# Altium schematic sheet 13_Radar_interfaces_and_QSPI.SchDoc
size 289 x 575 mm
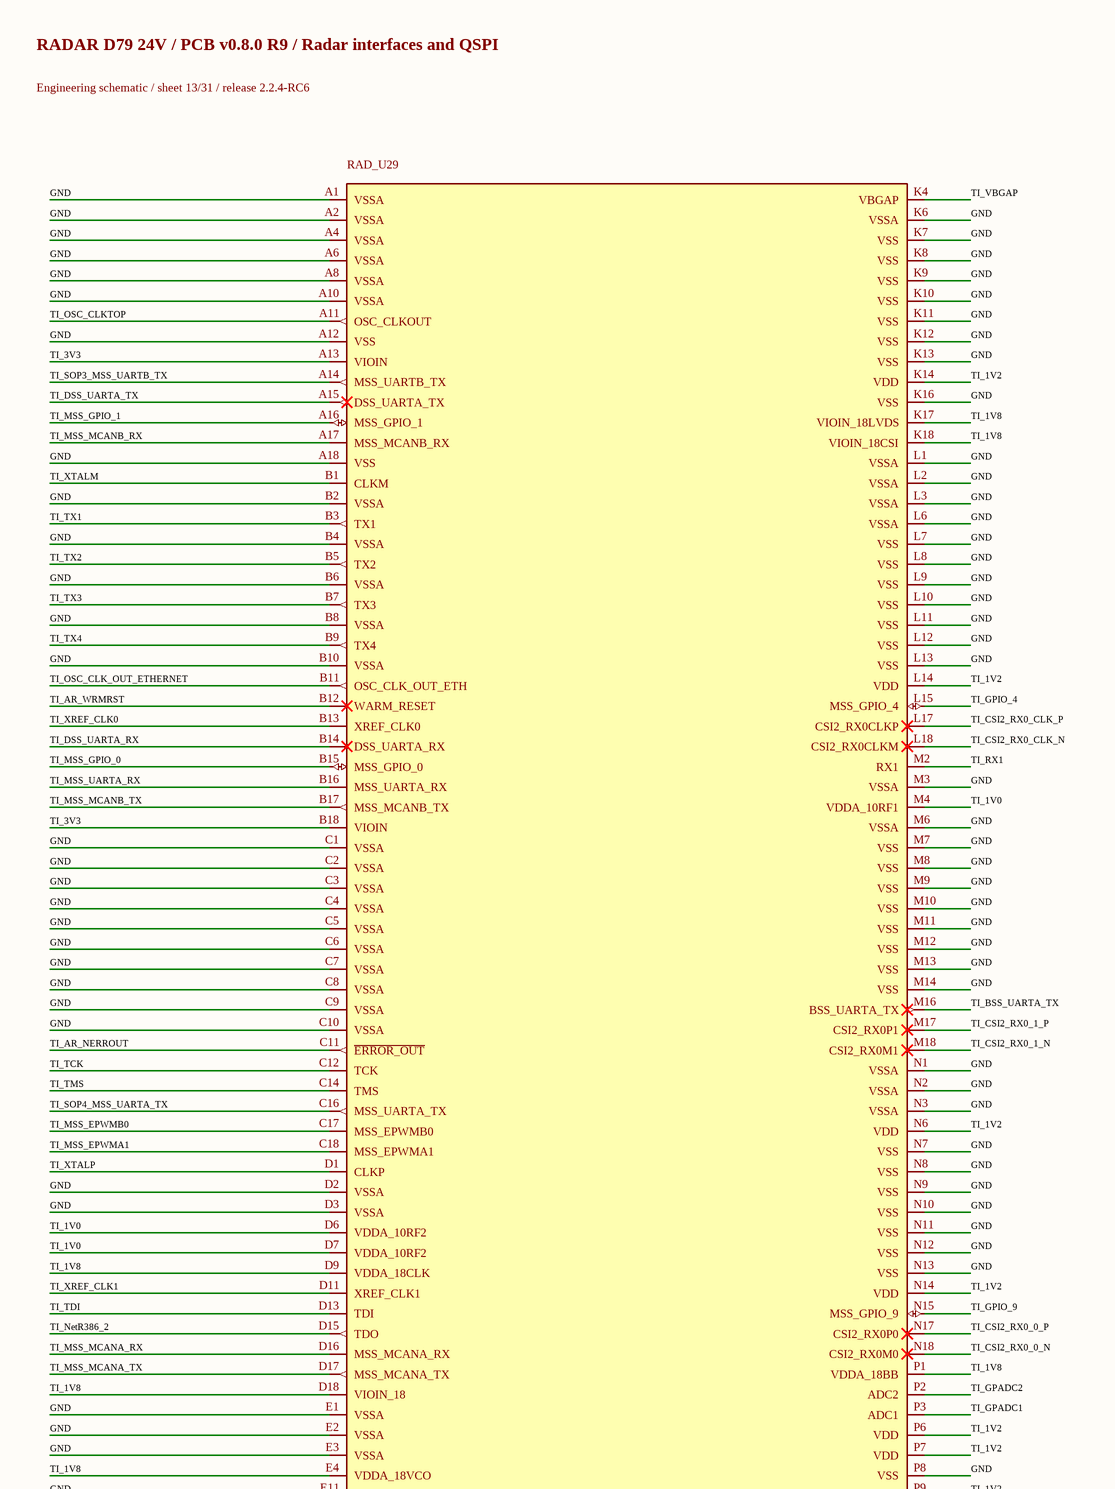
[diagram p0: 13_Radar_interfaces_and_QSPI.SchDoc, top]
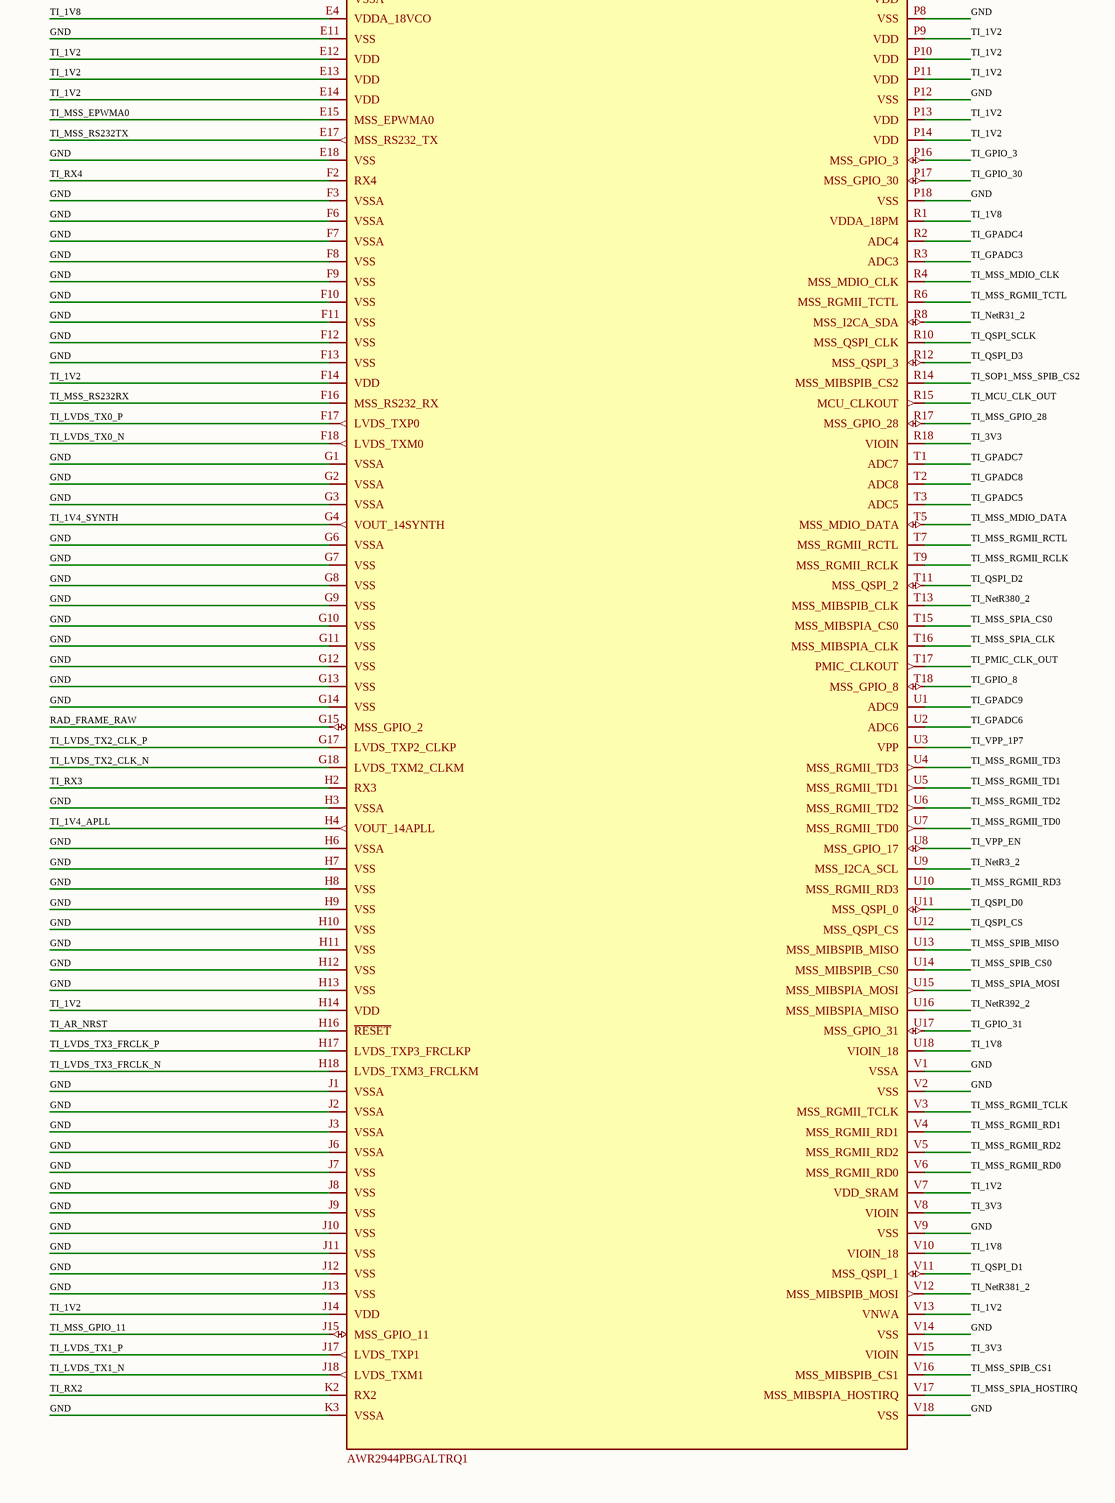
[diagram p1: 13_Radar_interfaces_and_QSPI.SchDoc, bottom]

## Parts
RAD_U29  AWR2944PBGALTRQ1  [ALT0266A-MFG]

## Nets
GND: RAD_U29.A1(VSSA) RAD_U29.A2(VSSA) RAD_U29.A4(VSSA) RAD_U29.A6(VSSA) RAD_U29.A8(VSSA) RAD_U29.A10(VSSA) RAD_U29.A12(VSS) RAD_U29.A18(VSS) RAD_U29.B2(VSSA) RAD_U29.B4(VSSA) RAD_U29.B6(VSSA) RAD_U29.B8(VSSA) RAD_U29.B10(VSSA) RAD_U29.C1(VSSA) RAD_U29.C2(VSSA) RAD_U29.C3(VSSA) RAD_U29.C4(VSSA) RAD_U29.C5(VSSA) RAD_U29.C6(VSSA) RAD_U29.C7(VSSA) RAD_U29.C8(VSSA) RAD_U29.C9(VSSA) RAD_U29.C10(VSSA) RAD_U29.D2(VSSA) RAD_U29.D3(VSSA) RAD_U29.E1(VSSA) RAD_U29.E2(VSSA) RAD_U29.E3(VSSA) RAD_U29.E11(VSS) RAD_U29.E18(VSS) RAD_U29.F3(VSSA) RAD_U29.F6(VSSA) RAD_U29.F7(VSSA) RAD_U29.F8(VSS) RAD_U29.F9(VSS) RAD_U29.F10(VSS) RAD_U29.F11(VSS) RAD_U29.F12(VSS) RAD_U29.F13(VSS) RAD_U29.G1(VSSA) RAD_U29.G2(VSSA) RAD_U29.G3(VSSA) RAD_U29.G6(VSSA) RAD_U29.G7(VSS) RAD_U29.G8(VSS) RAD_U29.G9(VSS) RAD_U29.G10(VSS) RAD_U29.G11(VSS) RAD_U29.G12(VSS) RAD_U29.G13(VSS) RAD_U29.G14(VSS) RAD_U29.H3(VSSA) RAD_U29.H6(VSSA) RAD_U29.H7(VSS) RAD_U29.H8(VSS) RAD_U29.H9(VSS) RAD_U29.H10(VSS) RAD_U29.H11(VSS) RAD_U29.H12(VSS) RAD_U29.H13(VSS) RAD_U29.J1(VSSA) RAD_U29.J2(VSSA) RAD_U29.J3(VSSA) RAD_U29.J6(VSSA) RAD_U29.J7(VSS) RAD_U29.J8(VSS) RAD_U29.J9(VSS) RAD_U29.J10(VSS) RAD_U29.J11(VSS) RAD_U29.J12(VSS) RAD_U29.J13(VSS) RAD_U29.K3(VSSA) RAD_U29.K6(VSSA) RAD_U29.K7(VSS) RAD_U29.K8(VSS) RAD_U29.K9(VSS) RAD_U29.K10(VSS) RAD_U29.K11(VSS) RAD_U29.K12(VSS) RAD_U29.K13(VSS) RAD_U29.K16(VSS) RAD_U29.L1(VSSA) RAD_U29.L2(VSSA) RAD_U29.L3(VSSA) RAD_U29.L6(VSSA) RAD_U29.L7(VSS) RAD_U29.L8(VSS) RAD_U29.L9(VSS) RAD_U29.L10(VSS) RAD_U29.L11(VSS) RAD_U29.L12(VSS) RAD_U29.L13(VSS) RAD_U29.M3(VSSA) RAD_U29.M6(VSSA) RAD_U29.M7(VSS) RAD_U29.M8(VSS) RAD_U29.M9(VSS) RAD_U29.M10(VSS) RAD_U29.M11(VSS) RAD_U29.M12(VSS) RAD_U29.M13(VSS) RAD_U29.M14(VSS) RAD_U29.N1(VSSA) RAD_U29.N2(VSSA) RAD_U29.N3(VSSA) RAD_U29.N7(VSS) RAD_U29.N8(VSS) RAD_U29.N9(VSS) RAD_U29.N10(VSS) RAD_U29.N11(VSS) RAD_U29.N12(VSS) RAD_U29.N13(VSS) RAD_U29.P8(VSS) RAD_U29.P12(VSS) RAD_U29.P18(VSS) RAD_U29.V1(VSSA) RAD_U29.V2(VSS) RAD_U29.V9(VSS) RAD_U29.V14(VSS) RAD_U29.V18(VSS)
RAD_FRAME_RAW: RAD_U29.G15(MSS_GPIO_2)
TI_1V0: RAD_U29.D6(VDDA_10RF2) RAD_U29.D7(VDDA_10RF2) RAD_U29.M4(VDDA_10RF1)
TI_1V2: RAD_U29.E12(VDD) RAD_U29.E13(VDD) RAD_U29.E14(VDD) RAD_U29.F14(VDD) RAD_U29.H14(VDD) RAD_U29.J14(VDD) RAD_U29.K14(VDD) RAD_U29.L14(VDD) RAD_U29.N6(VDD) RAD_U29.N14(VDD) RAD_U29.P6(VDD) RAD_U29.P7(VDD) RAD_U29.P9(VDD) RAD_U29.P10(VDD) RAD_U29.P11(VDD) RAD_U29.P13(VDD) RAD_U29.P14(VDD) RAD_U29.V7(VDD_SRAM) RAD_U29.V13(VNWA)
TI_1V4_APLL: RAD_U29.H4(VOUT_14APLL)
TI_1V4_SYNTH: RAD_U29.G4(VOUT_14SYNTH)
TI_1V8: RAD_U29.D9(VDDA_18CLK) RAD_U29.D18(VIOIN_18) RAD_U29.E4(VDDA_18VCO) RAD_U29.K17(VIOIN_18LVDS) RAD_U29.K18(VIOIN_18CSI) RAD_U29.P1(VDDA_18BB) RAD_U29.R1(VDDA_18PM) RAD_U29.U18(VIOIN_18) RAD_U29.V10(VIOIN_18)
TI_3V3: RAD_U29.A13(VIOIN) RAD_U29.B18(VIOIN) RAD_U29.R18(VIOIN) RAD_U29.V8(VIOIN) RAD_U29.V15(VIOIN)
TI_AR_NERROUT: RAD_U29.C11(~{ERROR_OUT})
TI_AR_NRST: RAD_U29.H16(~{RESET})
TI_AR_WRMRST: RAD_U29.B12(WARM_RESET)
TI_BSS_UARTA_TX: RAD_U29.M16(BSS_UARTA_TX)
TI_CSI2_RX0_0_N: RAD_U29.N18(CSI2_RX0M0)
TI_CSI2_RX0_0_P: RAD_U29.N17(CSI2_RX0P0)
TI_CSI2_RX0_1_N: RAD_U29.M18(CSI2_RX0M1)
TI_CSI2_RX0_1_P: RAD_U29.M17(CSI2_RX0P1)
TI_CSI2_RX0_CLK_N: RAD_U29.L18(CSI2_RX0CLKM)
TI_CSI2_RX0_CLK_P: RAD_U29.L17(CSI2_RX0CLKP)
TI_DSS_UARTA_RX: RAD_U29.B14(DSS_UARTA_RX)
TI_DSS_UARTA_TX: RAD_U29.A15(DSS_UARTA_TX)
TI_GPADC1: RAD_U29.P3(ADC1)
TI_GPADC2: RAD_U29.P2(ADC2)
TI_GPADC3: RAD_U29.R3(ADC3)
TI_GPADC4: RAD_U29.R2(ADC4)
TI_GPADC5: RAD_U29.T3(ADC5)
TI_GPADC6: RAD_U29.U2(ADC6)
TI_GPADC7: RAD_U29.T1(ADC7)
TI_GPADC8: RAD_U29.T2(ADC8)
TI_GPADC9: RAD_U29.U1(ADC9)
TI_GPIO_3: RAD_U29.P16(MSS_GPIO_3)
TI_GPIO_4: RAD_U29.L15(MSS_GPIO_4)
TI_GPIO_8: RAD_U29.T18(MSS_GPIO_8)
TI_GPIO_9: RAD_U29.N15(MSS_GPIO_9)
TI_GPIO_30: RAD_U29.P17(MSS_GPIO_30)
TI_GPIO_31: RAD_U29.U17(MSS_GPIO_31)
TI_LVDS_TX0_N: RAD_U29.F18(LVDS_TXM0)
TI_LVDS_TX0_P: RAD_U29.F17(LVDS_TXP0)
TI_LVDS_TX1_N: RAD_U29.J18(LVDS_TXM1)
TI_LVDS_TX1_P: RAD_U29.J17(LVDS_TXP1)
TI_LVDS_TX2_CLK_N: RAD_U29.G18(LVDS_TXM2_CLKM)
TI_LVDS_TX2_CLK_P: RAD_U29.G17(LVDS_TXP2_CLKP)
TI_LVDS_TX3_FRCLK_N: RAD_U29.H18(LVDS_TXM3_FRCLKM)
TI_LVDS_TX3_FRCLK_P: RAD_U29.H17(LVDS_TXP3_FRCLKP)
TI_MCU_CLK_OUT: RAD_U29.R15(MCU_CLKOUT)
TI_MSS_EPWMA0: RAD_U29.E15(MSS_EPWMA0)
TI_MSS_EPWMA1: RAD_U29.C18(MSS_EPWMA1)
TI_MSS_EPWMB0: RAD_U29.C17(MSS_EPWMB0)
TI_MSS_GPIO_0: RAD_U29.B15(MSS_GPIO_0)
TI_MSS_GPIO_1: RAD_U29.A16(MSS_GPIO_1)
TI_MSS_GPIO_11: RAD_U29.J15(MSS_GPIO_11)
TI_MSS_GPIO_28: RAD_U29.R17(MSS_GPIO_28)
TI_MSS_MCANA_RX: RAD_U29.D16(MSS_MCANA_RX)
TI_MSS_MCANA_TX: RAD_U29.D17(MSS_MCANA_TX)
TI_MSS_MCANB_RX: RAD_U29.A17(MSS_MCANB_RX)
TI_MSS_MCANB_TX: RAD_U29.B17(MSS_MCANB_TX)
TI_MSS_MDIO_CLK: RAD_U29.R4(MSS_MDIO_CLK)
TI_MSS_MDIO_DATA: RAD_U29.T5(MSS_MDIO_DATA)
TI_MSS_RGMII_RCLK: RAD_U29.T9(MSS_RGMII_RCLK)
TI_MSS_RGMII_RCTL: RAD_U29.T7(MSS_RGMII_RCTL)
TI_MSS_RGMII_RD0: RAD_U29.V6(MSS_RGMII_RD0)
TI_MSS_RGMII_RD1: RAD_U29.V4(MSS_RGMII_RD1)
TI_MSS_RGMII_RD2: RAD_U29.V5(MSS_RGMII_RD2)
TI_MSS_RGMII_RD3: RAD_U29.U10(MSS_RGMII_RD3)
TI_MSS_RGMII_TCLK: RAD_U29.V3(MSS_RGMII_TCLK)
TI_MSS_RGMII_TCTL: RAD_U29.R6(MSS_RGMII_TCTL)
TI_MSS_RGMII_TD0: RAD_U29.U7(MSS_RGMII_TD0)
TI_MSS_RGMII_TD1: RAD_U29.U5(MSS_RGMII_TD1)
TI_MSS_RGMII_TD2: RAD_U29.U6(MSS_RGMII_TD2)
TI_MSS_RGMII_TD3: RAD_U29.U4(MSS_RGMII_TD3)
TI_MSS_RS232RX: RAD_U29.F16(MSS_RS232_RX)
TI_MSS_RS232TX: RAD_U29.E17(MSS_RS232_TX)
TI_MSS_SPIA_CLK: RAD_U29.T16(MSS_MIBSPIA_CLK)
TI_MSS_SPIA_CS0: RAD_U29.T15(MSS_MIBSPIA_CS0)
TI_MSS_SPIA_HOSTIRQ: RAD_U29.V17(MSS_MIBSPIA_HOSTIRQ)
TI_MSS_SPIA_MOSI: RAD_U29.U15(MSS_MIBSPIA_MOSI)
TI_MSS_SPIB_CS0: RAD_U29.U14(MSS_MIBSPIB_CS0)
TI_MSS_SPIB_CS1: RAD_U29.V16(MSS_MIBSPIB_CS1)
TI_MSS_SPIB_MISO: RAD_U29.U13(MSS_MIBSPIB_MISO)
TI_MSS_UARTA_RX: RAD_U29.B16(MSS_UARTA_RX)
TI_NetR3_2: RAD_U29.U9(MSS_I2CA_SCL)
TI_NetR31_2: RAD_U29.R8(MSS_I2CA_SDA)
TI_NetR380_2: RAD_U29.T13(MSS_MIBSPIB_CLK)
TI_NetR381_2: RAD_U29.V12(MSS_MIBSPIB_MOSI)
TI_NetR386_2: RAD_U29.D15(TDO)
TI_NetR392_2: RAD_U29.U16(MSS_MIBSPIA_MISO)
TI_OSC_CLK_OUT_ETHERNET: RAD_U29.B11(OSC_CLK_OUT_ETH)
TI_OSC_CLKTOP: RAD_U29.A11(OSC_CLKOUT)
TI_PMIC_CLK_OUT: RAD_U29.T17(PMIC_CLKOUT)
TI_QSPI_CS: RAD_U29.U12(MSS_QSPI_CS)
TI_QSPI_D0: RAD_U29.U11(MSS_QSPI_0)
TI_QSPI_D1: RAD_U29.V11(MSS_QSPI_1)
TI_QSPI_D2: RAD_U29.T11(MSS_QSPI_2)
TI_QSPI_D3: RAD_U29.R12(MSS_QSPI_3)
TI_QSPI_SCLK: RAD_U29.R10(MSS_QSPI_CLK)
TI_RX1: RAD_U29.M2(RX1)
TI_RX2: RAD_U29.K2(RX2)
TI_RX3: RAD_U29.H2(RX3)
TI_RX4: RAD_U29.F2(RX4)
TI_SOP1_MSS_SPIB_CS2: RAD_U29.R14(MSS_MIBSPIB_CS2)
TI_SOP3_MSS_UARTB_TX: RAD_U29.A14(MSS_UARTB_TX)
TI_SOP4_MSS_UARTA_TX: RAD_U29.C16(MSS_UARTA_TX)
TI_TCK: RAD_U29.C12(TCK)
TI_TDI: RAD_U29.D13(TDI)
TI_TMS: RAD_U29.C14(TMS)
TI_TX1: RAD_U29.B3(TX1)
TI_TX2: RAD_U29.B5(TX2)
TI_TX3: RAD_U29.B7(TX3)
TI_TX4: RAD_U29.B9(TX4)
TI_VBGAP: RAD_U29.K4(VBGAP)
TI_VPP_1P7: RAD_U29.U3(VPP)
TI_VPP_EN: RAD_U29.U8(MSS_GPIO_17)
TI_XREF_CLK0: RAD_U29.B13(XREF_CLK0)
TI_XREF_CLK1: RAD_U29.D11(XREF_CLK1)
TI_XTALM: RAD_U29.B1(CLKM)
TI_XTALP: RAD_U29.D1(CLKP)

## Notes on the sheet
- RADAR D79 24V / PCB v0.8.0 R9 / Radar interfaces and QSPI
- Engineering schematic / sheet 13/31 / release 2.2.4-RC6